# Altium schematic sheet DXES101B-659637-POWER-AND-SIGNALS.SchDoc
size A3; Organization: Altium Limited; Address1: 3 Minna Close; Address2: Belrose; Address3: NSW 2085; Address4: Australia; SheetNumber: 2; SheetTotal: 10
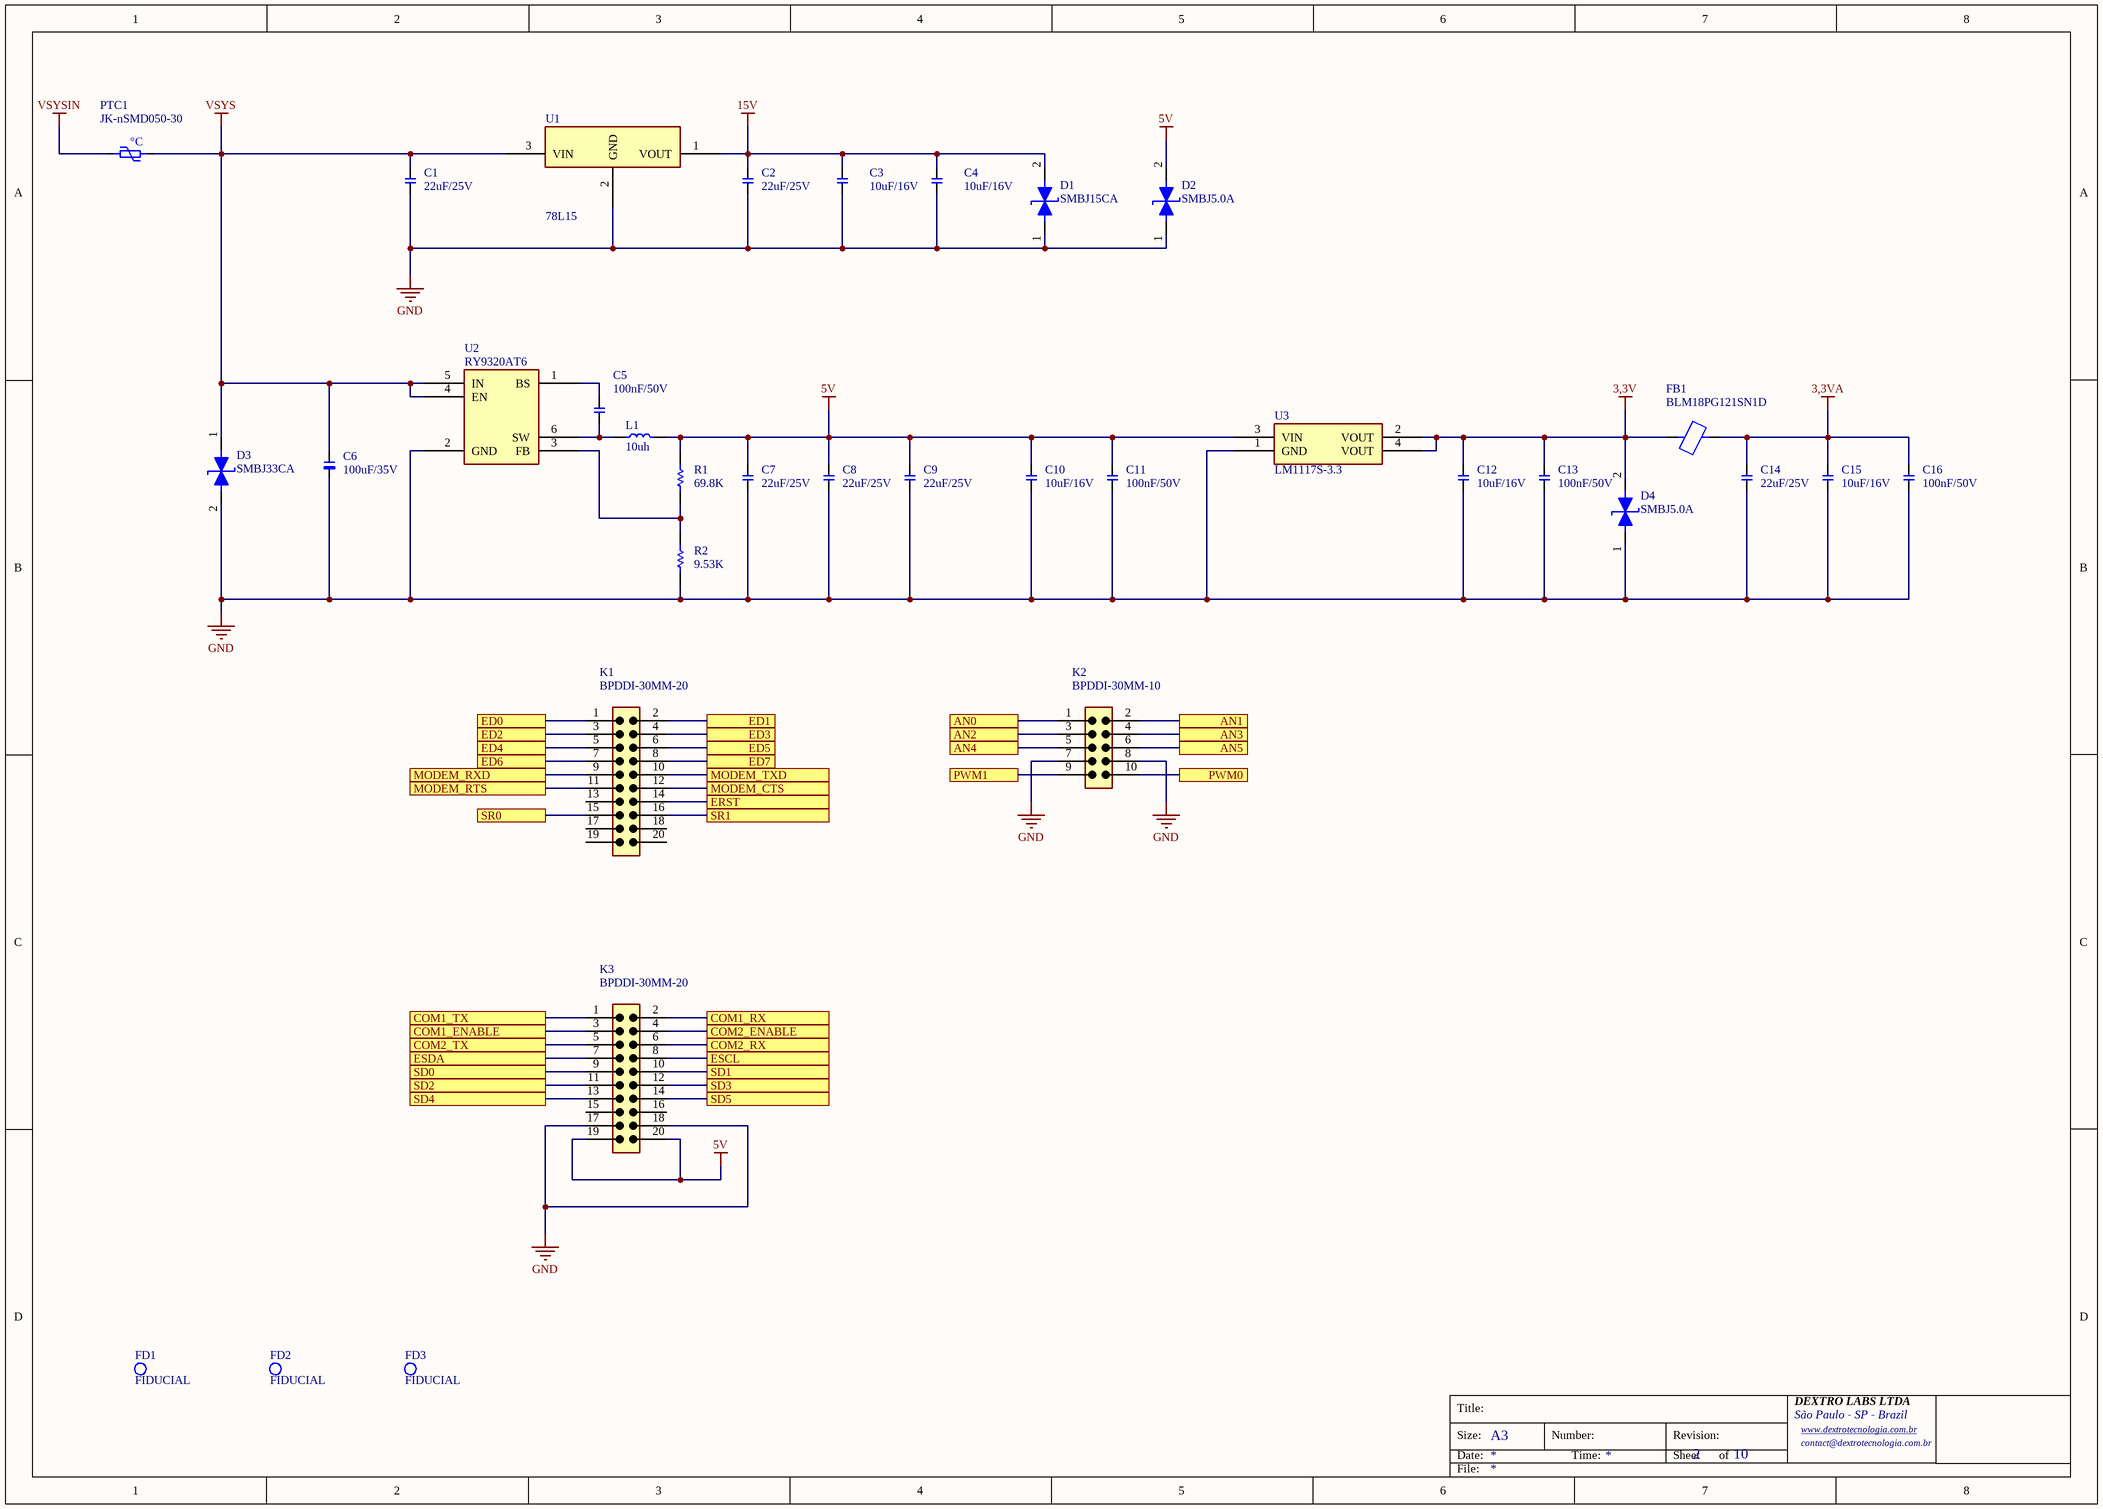
[diagram p0: DXES101B-659637-POWER-AND-SIGNALS.SchDoc]

## Parts
C1  22uF/25V  [CAP-1206]
C2  22uF/25V  [CAP-1206]
C3  10uF/16V  [CAP-0603]
C4  10uF/16V  [CAP-0603]
C5  100nF/50V  [CAP-0603]
C6  100uF/35V  [CAP-TH_BD6.3-P2.50-D1.0-FD]
C7  22uF/25V  [CAP-1206]
C8  22uF/25V  [CAP-1206]
C9  22uF/25V  [CAP-1206]
C10  10uF/16V  [CAP-0603]
C11  100nF/50V  [CAP-0603]
C12  10uF/16V  [CAP-0603]
C13  100nF/50V  [CAP-0603]
C14  22uF/25V  [CAP-1206]
C15  10uF/16V  [CAP-0603]
C16  100nF/50V  [CAP-0603]
D1  SMBJ15CA  [DO214-AA]
D2  SMBJ5.0A  [DO214-AA]
D3  SMBJ33CA  [DO214-AA]
D4  SMBJ5.0A  [DO214-AA]
FB1  BLM18PG121SN1D  [RES-0603]
FD1  FIDUCIAL  [FIDUCIAL]
FD2  FIDUCIAL  [FIDUCIAL]
FD3  FIDUCIAL  [FIDUCIAL]
K1  BPDDI-30MM-20  [BPDDI-30MM-20]
K2  BPDDI-30MM-10  [BPDDI-30MM-10]
K3  BPDDI-30MM-20  [BPDDI-30MM-20]
L1  10uh  [IND-SMD_2P-L5.0-W5.0]
PTC1  JK-nSMD050-30  [PTC-1206]
R1  69.8K  [RES-0603]
R2  9.53K  [RES-0603]
U1  78L15  [SOT-89-3_L4.5-W2.5-P1.50-LS4.1-BR]
U2  RY9320AT6  [SOT23-6]
U3  LM1117S-3.3  [SOT-223-3_L6.7-W3.7-P2.30-LS7.0-BR_2]

## Ports
AN0 (see DXES101B-659637-GENERAL[2B], DXES101B-659637-ANALOG-INPUTS[4A]), AN1 (see DXES101B-659637-GENERAL[2B], DXES101B-659637-ANALOG-INPUTS[8A]), AN2 (see DXES101B-659637-GENERAL[2B], DXES101B-659637-ANALOG-INPUTS[4B]), AN3 (see DXES101B-659637-GENERAL[2B], DXES101B-659637-ANALOG-INPUTS[8B]), AN4 (see DXES101B-659637-GENERAL[2B], DXES101B-659637-ANALOG-INPUTS[4C]), AN5 (see DXES101B-659637-GENERAL[2B], DXES101B-659637-ANALOG-INPUTS[8C]), COM1_ENABLE (see DXES101B-659637-GENERAL[2C], DXES101B-659637-COMM-PORTS[3A]), COM1_RX (see DXES101B-659637-GENERAL[2C], DXES101B-659637-COMM-PORTS[3A]), COM1_TX (see DXES101B-659637-GENERAL[2C], DXES101B-659637-COMM-PORTS[3A]), COM2_ENABLE (see DXES101B-659637-GENERAL[2C], DXES101B-659637-COMM-PORTS[3B]), COM2_RX (see DXES101B-659637-GENERAL[2C], DXES101B-659637-COMM-PORTS[3B]), COM2_TX (see DXES101B-659637-GENERAL[2C], DXES101B-659637-COMM-PORTS[3B]), ED0 (see DXES101B-659637-GENERAL[2B], DXES101B-659637-DIGITAL-INPUTS[4A]), ED1 (see DXES101B-659637-GENERAL[2B], DXES101B-659637-DIGITAL-INPUTS[7A]), ED2 (see DXES101B-659637-GENERAL[2B], DXES101B-659637-DIGITAL-INPUTS[4B]), ED3 (see DXES101B-659637-GENERAL[2B], DXES101B-659637-DIGITAL-INPUTS[7B]), ED4 (see DXES101B-659637-GENERAL[2B], DXES101B-659637-DIGITAL-INPUTS[4B]), ED5 (see DXES101B-659637-GENERAL[2B], DXES101B-659637-DIGITAL-INPUTS[7B]), ED6 (see DXES101B-659637-GENERAL[2B], DXES101B-659637-DIGITAL-INPUTS[4C]), ED7 (see DXES101B-659637-GENERAL[2B], DXES101B-659637-DIGITAL-INPUTS[7C]), ERST (see DXES101B-659637-GENERAL[2C], DXES101B-659637-EXPANSION-BUS[4B]), ESCL (see DXES101B-659637-GENERAL[2C], DXES101B-659637-EXPANSION-BUS[4B]), ESDA (see DXES101B-659637-GENERAL[2C], DXES101B-659637-EXPANSION-BUS[4B]), MODEM_CTS (see DXES101B-659637-GENERAL[2C], DXES101B-659637-MODEM-PORT[4B]), MODEM_RTS (see DXES101B-659637-GENERAL[2C], DXES101B-659637-MODEM-PORT[4B]), MODEM_RXD (see DXES101B-659637-GENERAL[2C], DXES101B-659637-MODEM-PORT[4B]), MODEM_TXD (see DXES101B-659637-GENERAL[2C], DXES101B-659637-MODEM-PORT[4B]), PWM0 (see DXES101B-659637-GENERAL[2C], DXES101B-659637-ANALOG-OUTPUTS[2A]), PWM1 (see DXES101B-659637-GENERAL[2C], DXES101B-659637-ANALOG-OUTPUTS[2C]), SD0 (see DXES101B-659637-GENERAL[2A], DXES101B-659637-DIGITAL-OUTPUTS[1B]), SD1 (see DXES101B-659637-GENERAL[2A], DXES101B-659637-DIGITAL-OUTPUTS[3B]), SD2 (see DXES101B-659637-GENERAL[2A], DXES101B-659637-DIGITAL-OUTPUTS[6B]), SD3 (see DXES101B-659637-GENERAL[2A], DXES101B-659637-DIGITAL-OUTPUTS[1C]), SD4 (see DXES101B-659637-GENERAL[2A], DXES101B-659637-DIGITAL-OUTPUTS[3C]), SD5 (see DXES101B-659637-GENERAL[2A], DXES101B-659637-DIGITAL-OUTPUTS[6C]), SR0 (see DXES101B-659637-GENERAL[2A], DXES101B-659637-RELAYS[3B]), SR1 (see DXES101B-659637-GENERAL[2A], DXES101B-659637-RELAYS[3C])

## Nets
3,3V: C12.2 C13.2 D4.2(A2) FB1.1 U3.2(VOUT) U3.4(VOUT)
3,3VA: C14.2 C15.2 C16.2 FB1.2
5V: C7.2 C8.2 C9.2 C10.2 C11.2 D2.2(A2) K3.19 K3.20 L1.2 R1.2 U3.3(VIN)
15V: C2.2 C3.2 C4.2 D1.2(A2) U1.1(VOUT)
GND: C1.1 C2.1 C3.1 C4.1 C6.2 C7.1 C8.1 C9.1 C10.1 C11.1 C12.1 C13.1 C14.1 C15.1 C16.1 D1.1(A1) D2.1(A1) D3.2(A1) D4.1(A1) K2.7 K2.8 K3.17 K3.18 R2.1 U1.2(GND) U2.2(GND) U3.1(GND)
VSYS: C1.2 C6.1 D3.1(A2) PTC1.2 U1.3(VIN) U2.4(EN) U2.5(IN)
VSYSIN: PTC1.1
AN0: K2.1 ; port AN0
AN1: K2.2 ; port AN1
AN2: K2.3 ; port AN2
AN3: K2.4 ; port AN3
AN4: K2.5 ; port AN4
AN5: K2.6 ; port AN5
COM1_ENABLE: K3.3 ; port COM1_ENABLE
COM1_RX: K3.2 ; port COM1_RX
COM1_TX: K3.1 ; port COM1_TX
COM2_ENABLE: K3.4 ; port COM2_ENABLE
COM2_RX: K3.6 ; port COM2_RX
COM2_TX: K3.5 ; port COM2_TX
ED0: K1.1 ; port ED0
ED1: K1.2 ; port ED1
ED2: K1.3 ; port ED2
ED3: K1.4 ; port ED3
ED4: K1.5 ; port ED4
ED5: K1.6 ; port ED5
ED6: K1.7 ; port ED6
ED7: K1.8 ; port ED7
ERST: K1.14 ; port ERST
ESCL: K3.8 ; port ESCL
ESDA: K3.7 ; port ESDA
MODEM_CTS: K1.12 ; port MODEM_CTS
MODEM_RTS: K1.11 ; port MODEM_RTS
MODEM_RXD: K1.9 ; port MODEM_RXD
MODEM_TXD: K1.10 ; port MODEM_TXD
PWM0: K2.10 ; port PWM0
PWM1: K2.9 ; port PWM1
SD0: K3.9 ; port SD0
SD1: K3.10 ; port SD1
SD2: K3.11 ; port SD2
SD3: K3.12 ; port SD3
SD4: K3.13 ; port SD4
SD5: K3.14 ; port SD5
SR0: K1.15 ; port SR0
SR1: K1.16 ; port SR1
NetC5_1: C5.1 L1.1 U2.6(SW)
NetC5_2: C5.2 U2.1(BS)
NetR1_1: R1.1 R2.2 U2.3(FB)

Not connected (* = marked no-connect by the designer): K1 13 17 18 19 20; K3 15 16

## Notes on the sheet
- Title:
- Size:
- Date:
- A3
- Number:
- Time:
- Revision:
- Sheet
- of
- DEXTRO LABS LTDA
- São Paulo - SP - Brazil
- www.dextrotecnologia.com.br <http://www.dextrotecnologia.com.br>
- contact@dextrotecnologia.com.br
- File:
- (in symbol PTC-FUSE-30V-500mA-1206) °C

## Library data of the parts
C1 C2 C7-C9 C14 = CAP-22uF/25V-1206-X5R-MLCC: 25V 22uF X5R ±10% 1206 Multilayer Ceramic Capacitors MLCC - SMD/SMT ROHS; LCSC: C12891
C3 C4 C10 C12 C15 = CAP-10uF/16V-0603-X5R: 16V 10uF X5R ±20% 0603 Multilayer Ceramic Capacitors MLCC - SMD/SMT ROHS; LCSC: C92487
C5 C11 C13 C16 = CAP-100nF/50V-0603-X7R-MLCC: 50V 100nF X7R ±10% 0603 Multilayer Ceramic Capacitors MLCC - SMD/SMT ROHS; LCSC: C14663
C6 = CAP-100uF/35V-ELET-D10xL20mm_1: 100uF 35V Aluminum Electrolytic Capacitors Through Hole,D6.3xL11mm 2000hrs@105℃; LCSC: C109392
D1 = SMBJ15CA: 24.6A 600W@8/20us 24.4V 19.2V Bidirectional 15V SMB(DO-214AA) ESD and Surge Protection (TVS/ESD) ROHS; LCSC: C2760879
D2 D4 = SMBJ5.0A: 65.3A 600W 9.2V 6.4V Unidirectional 5V DO-214AA ESD and Surge Protection (TVS/ESD) ROHS; LCSC: C83333
D3 = SMBJ33CA: A 600W@8/20us 24.4V 33V Bidirectional 15V SMB(DO-214AA) ESD and Surge Protection (TVS/ESD) ROHS; LCSC: C3001986
FB1 = BLM18PG121SN1D: FERRITE BEAD 120Ω 0603 1LN; LCSC: C14709
K1 K3 = BPDDI-30MM-20: BARRA DE PINOS DUPLA 2,54mm 20 VIAS 180º DUPLO ISOLADOR PINO 30mm
K2 = BPDDI-30MM-10: BARRA DE PINOS DUPLA 2,54mm 10 VIAS 180º DUPLO ISOLADOR PINO 30mm
L1 = FIXED-INDUCTOR-SMD-10uH-5X5mm-2A-15mΩ_1: 2A 10uH ±20% Magnetic Shielded Inductor 2A SMD,5x5mm Fixed Inductors RoHS; LCSC: C9389
PTC1 = PTC-FUSE-30V-500mA-1206: 30V 500mA 100A 1A 150mΩ 1206 PTC Resettable Fuses ROHS; LCSC: C720075
R1 = RES-69.8K-1%-100mW-0603_1: 100mW Thick Film Resistor 75V ±100ppm/℃ ±1% 69.8K 0603 Chip Resistor - Surface Mount ROHS; LCSC: C2907025
R2 = RES-9.53K-1%-100mW-0603: 100mW Thick Film Resistor 75V ±100ppm/℃ ±1% 9.53K 0603 Chip Resistor - Surface Mount ROHS; LCSC: C23127
U1 = 78L15: 3-Terminal Positive Voltage Regulator - SOT89; LCSC: C5309538
U2 = RY9320AT6: 500kHz Buck Adjustable 2A SOT-23-6 Voltage Regulators - DC DC Switching Regulators RoHS; LCSCC: C2962442
U3 = LM1117S-3.3: LCSC: C126027